# Altium schematic sheet PCB-MIC.SchDoc
size 297 x 209 mm
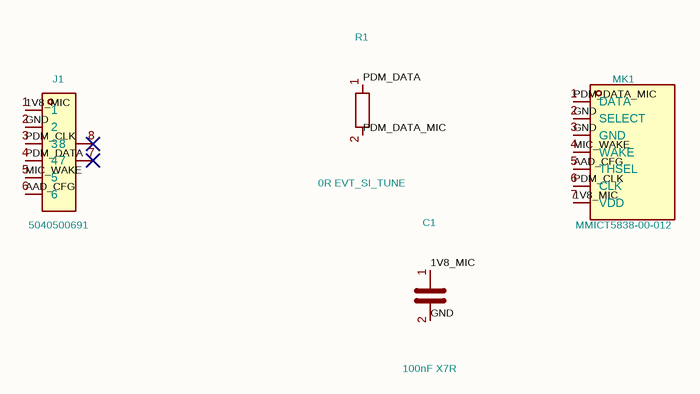
[diagram p0: PCB-MIC.SchDoc]

## Parts
C1  100nF X7R  [C_0402_1005Metric]
J1  5040500691  [Molex_5040500691]
MK1  MMICT5838-00-012  [T5838_RevA]
R1  0R EVT_SI_TUNE  [R_0402_1005Metric]

## Nets
1V8_MIC: C1.1 J1.1 MK1.7(VDD)
AAD_CFG: J1.6 MK1.5(THSEL)
GND: C1.2 J1.2 MK1.2(SELECT) MK1.3(GND)
MIC_WAKE: J1.5 MK1.4(WAKE)
PDM_CLK: J1.3 MK1.6(CLK)
PDM_DATA: J1.4 R1.1
PDM_DATA_MIC: MK1.1(DATA) R1.2

Not connected (* = marked no-connect by the designer): J1 7* 8*

## Notes on the sheet
- 1
- 2
- 3
- 4
- 5
- 6
- A
- B
- C
- T5838 PDM + AAD WAKE + THSEL
- NOT FOR MANUFACTURE until Review A/B
- D
- Title: Dioneya EVT-PRE-20 PCB-MIC Rev.A
- File: PCB-MIC.kicad_sch
- Sheet: /
- Dioneya / ZS-BPLA
- KiCad E.D.A.  kicad (5.1.4)-1
- Size: A4
- Date: 2026-09-09
- Rev: A
- Id: 1/1

## Library data of the parts
C1 = C: Value: 100nF X7R; Footprint: Capacitor_SMD:C_0402_1005Metric
R1 = R: Value: 0R EVT_SI_TUNE; Footprint: Resistor_SMD:R_0402_1005Metric
J1 = 5040500691: Value: 5040500691; Footprint: Dioneya:Molex_5040500691
MK1 = MMICT5838-00-012: Value: MMICT5838-00-012; Footprint: Dioneya:T5838_RevA